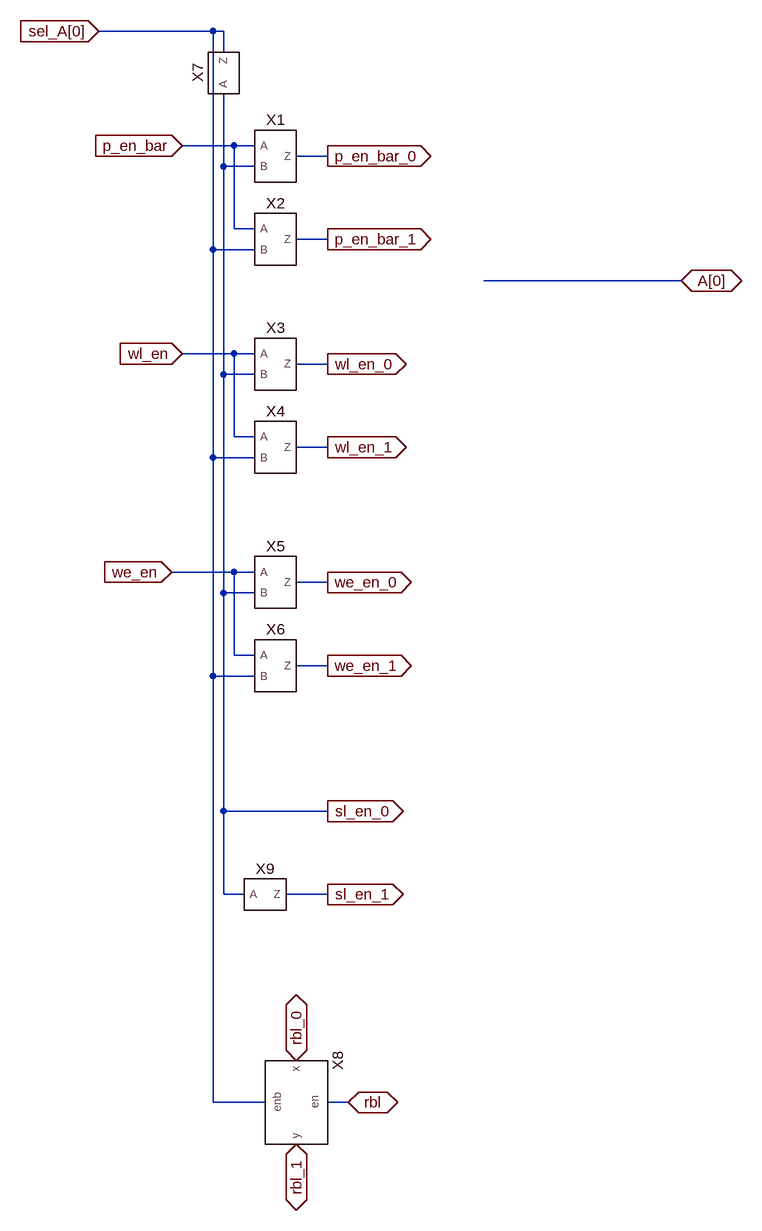
[diagram p0: schematic array_seclector.asc]
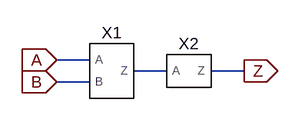
[diagram p1: sub-circuit and2.asc]
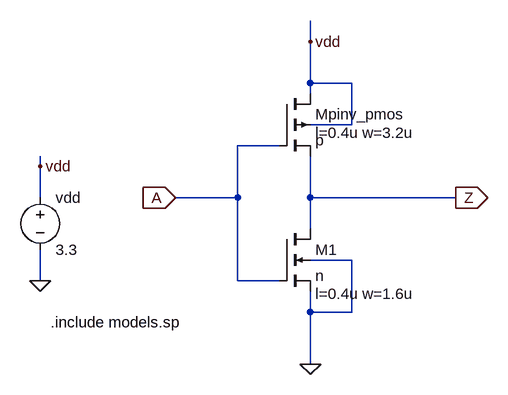
[diagram p2: sub-circuit inv.asc]
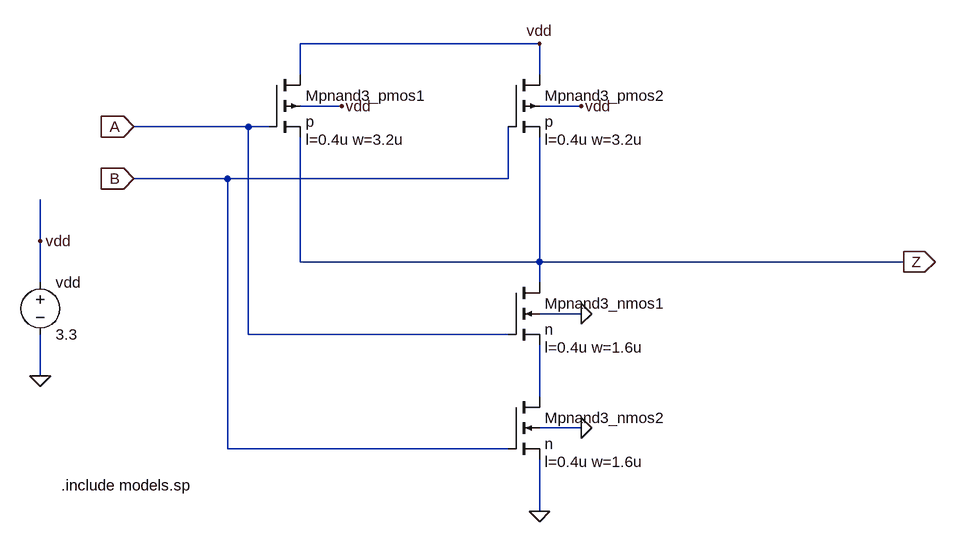
[diagram p3: sub-circuit nand2.asc]
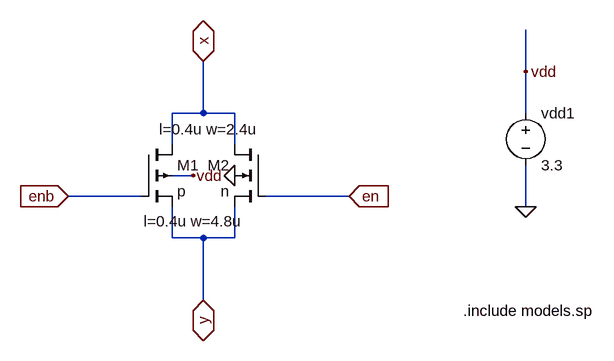
[diagram p4: sub-circuit tri_gate.asc]
array_seclector.asc, the LTspice schematic file:
Version 4
SHEET 1 1136 1560
WIRE 304 -272 128 -272
WIRE 320 -272 304 -272
WIRE 320 -240 320 -272
WIRE 336 -96 256 -96
WIRE 368 -96 336 -96
WIRE 480 -80 432 -80
WIRE 320 -64 320 -176
WIRE 368 -64 320 -64
WIRE 336 32 336 -96
WIRE 368 32 336 32
WIRE 480 48 432 48
WIRE 304 64 304 -272
WIRE 368 64 304 64
WIRE 1024 112 720 112
WIRE 336 224 256 224
WIRE 368 224 336 224
WIRE 480 240 432 240
WIRE 320 256 320 -64
WIRE 368 256 320 256
WIRE 336 352 336 224
WIRE 368 352 336 352
WIRE 480 368 432 368
WIRE 304 384 304 64
WIRE 368 384 304 384
WIRE 336 560 240 560
WIRE 368 560 336 560
WIRE 480 576 432 576
WIRE 320 592 320 256
WIRE 368 592 320 592
WIRE 336 688 336 560
WIRE 368 688 336 688
WIRE 480 704 432 704
WIRE 304 720 304 384
WIRE 368 720 304 720
WIRE 320 928 320 592
WIRE 480 928 320 928
WIRE 320 1056 320 928
WIRE 352 1056 320 1056
WIRE 480 1056 416 1056
WIRE 304 1376 304 720
WIRE 384 1376 304 1376
WIRE 512 1376 480 1376
FLAG 128 -272 sel_A[0]
IOPIN 128 -272 In
FLAG 256 -96 p_en_bar
IOPIN 256 -96 In
FLAG 256 224 wl_en
IOPIN 256 224 In
FLAG 240 560 we_en
IOPIN 240 560 In
FLAG 480 -80 p_en_bar_0
IOPIN 480 -80 Out
FLAG 480 48 p_en_bar_1
IOPIN 480 48 Out
FLAG 480 240 wl_en_0
IOPIN 480 240 Out
FLAG 480 368 wl_en_1
IOPIN 480 368 Out
FLAG 480 576 we_en_0
IOPIN 480 576 Out
FLAG 480 704 we_en_1
IOPIN 480 704 Out
FLAG 432 1312 rbl_0
IOPIN 432 1312 BiDir
FLAG 432 1440 rbl_1
IOPIN 432 1440 BiDir
FLAG 512 1376 rbl
IOPIN 512 1376 BiDir
FLAG 480 928 sl_en_0
IOPIN 480 928 Out
FLAG 480 1056 sl_en_1
IOPIN 480 1056 Out
FLAG 1024 112 A[0]
IOPIN 1024 112 BiDir
SYMBOL and2 400 -80 R0
SYMATTR InstName X1
SYMBOL and2 400 48 R0
SYMATTR InstName X2
SYMBOL and2 400 240 R0
SYMATTR InstName X3
SYMBOL and2 400 368 R0
SYMATTR InstName X4
SYMBOL and2 400 576 R0
SYMATTR InstName X5
SYMBOL and2 400 704 R0
SYMATTR InstName X6
SYMBOL inv 320 -208 R270
SYMATTR InstName X7
SYMBOL tri_gate 432 1376 R90
SYMATTR InstName X8
SYMBOL inv 384 1056 R0
SYMATTR InstName X9

and2.asc, the sub-circuit schematic file:
Version 4
SHEET 1 880 680
WIRE 48 96 0 96
WIRE 160 112 112 112
WIRE 272 112 224 112
WIRE 48 128 0 128
FLAG 0 96 A
IOPIN 0 96 In
FLAG 0 128 B
IOPIN 0 128 In
FLAG 272 112 Z
IOPIN 272 112 Out
SYMBOL inv 192 112 R0
SYMATTR InstName X2
SYMBOL nand2 80 112 R0
SYMATTR InstName X1

inv.asc, the sub-circuit schematic file:
Version 4
SHEET 1 880 680
WIRE 112 -128 112 -160
WIRE 112 -64 112 -128
WIRE 176 -64 112 -64
WIRE 112 -48 112 -64
WIRE 176 0 176 -64
WIRE 176 0 112 0
WIRE 64 32 0 32
WIRE -304 64 -304 48
WIRE -304 112 -304 64
WIRE 0 112 0 32
WIRE 0 112 -96 112
WIRE 112 112 112 48
WIRE 336 112 112 112
WIRE 112 160 112 112
WIRE 176 208 112 208
WIRE -304 240 -304 192
WIRE 0 240 0 112
WIRE 64 240 0 240
WIRE 112 288 112 256
WIRE 176 288 176 208
WIRE 176 288 112 288
WIRE 112 368 112 288
FLAG -96 112 A
IOPIN -96 112 In
FLAG 336 112 Z
IOPIN 336 112 Out
FLAG 112 368 0
FLAG -304 240 0
FLAG 112 -128 vdd
FLAG -304 64 vdd
SYMBOL nmos4 64 160 R0
WINDOW 123 56 100 Left 2
SYMATTR Value2 l=0.4u w=1.6u
SYMATTR InstName M1
SYMATTR Value n
SYMBOL pmos4 64 -48 R0
WINDOW 123 56 60 Left 2
SYMATTR Value2 l=0.4u w=3.2u
SYMATTR InstName Mpinv_pmos
SYMATTR Value p
SYMBOL voltage -304 96 R0
SYMATTR InstName vdd
SYMATTR Value 3.3
TEXT -288 304 Left 2 !.include models.sp

nand2.asc, the sub-circuit schematic file:
Version 4
SHEET 1 1192 1028
WIRE 560 128 192 128
WIRE 192 176 192 128
WIRE 560 176 560 128
WIRE 256 224 192 224
WIRE 624 224 560 224
WIRE 112 256 -64 256
WIRE 144 256 112 256
WIRE 80 336 -64 336
WIRE 512 336 512 256
WIRE 512 336 80 336
WIRE -208 432 -208 368
WIRE 192 464 192 272
WIRE 560 464 560 272
WIRE 560 464 192 464
WIRE 1120 464 560 464
WIRE -208 496 -208 432
WIRE 560 496 560 464
WIRE 624 544 560 544
WIRE 112 576 112 256
WIRE 512 576 112 576
WIRE -208 640 -208 576
WIRE 560 672 560 592
WIRE 624 720 560 720
WIRE 80 752 80 336
WIRE 512 752 80 752
WIRE 560 848 560 768
FLAG -64 256 A
IOPIN -64 256 In
FLAG -64 336 B
IOPIN -64 336 In
FLAG 1120 464 Z
IOPIN 1120 464 Out
FLAG -208 640 0
FLAG 624 544 0
FLAG 624 720 0
FLAG -208 432 vdd
FLAG 256 224 vdd
FLAG 624 224 vdd
FLAG 560 848 0
FLAG 560 128 vdd
SYMBOL pmos4 144 176 R0
WINDOW 123 56 100 Left 2
SYMATTR Value2 l=0.4u w=3.2u
SYMATTR InstName Mpnand3_pmos1
SYMATTR Value p
SYMBOL pmos4 512 176 R0
WINDOW 123 56 100 Left 2
SYMATTR Value2 l=0.4u w=3.2u
SYMATTR InstName Mpnand3_pmos2
SYMATTR Value p
SYMBOL nmos4 512 496 R0
WINDOW 123 56 100 Left 2
SYMATTR Value2 l=0.4u w=1.6u
SYMATTR InstName Mpnand3_nmos1
SYMATTR Value n
SYMBOL nmos4 512 672 R0
WINDOW 123 56 100 Left 2
SYMATTR Value2 l=0.4u w=1.6u
SYMATTR InstName Mpnand3_nmos2
SYMATTR Value n
SYMBOL voltage -208 480 R0
WINDOW 123 0 0 Left 0
WINDOW 39 0 0 Left 0
SYMATTR InstName vdd
SYMATTR Value 3.3
TEXT -176 808 Left 2 !.include models.sp

tri_gate.asc, the sub-circuit schematic file:
Version 4
SHEET 1 880 680
WIRE 576 -16 576 -80
WIRE 80 48 80 -32
WIRE 80 48 32 48
WIRE 128 48 80 48
WIRE 576 48 576 -16
WIRE 32 96 32 48
WIRE 128 96 128 48
WIRE 64 144 32 144
WIRE -16 176 -128 176
WIRE 304 176 176 176
WIRE 576 192 576 128
WIRE 32 240 32 192
WIRE 80 240 32 240
WIRE 128 240 128 192
WIRE 128 240 80 240
WIRE 80 336 80 240
FLAG 128 144 0
FLAG 64 144 vdd
FLAG 576 192 0
FLAG 576 -16 vdd
FLAG 80 336 y
IOPIN 80 336 BiDir
FLAG 80 -32 x
IOPIN 80 -32 BiDir
FLAG 304 176 en
IOPIN 304 176 In
FLAG -128 176 enb
IOPIN -128 176 In
SYMBOL pmos4 -16 96 R0
WINDOW 123 4 118 Left 2
SYMATTR Value2 l=0.4u w=4.8u
SYMATTR InstName M1
SYMATTR Value p
SYMBOL nmos4 176 96 M0
WINDOW 123 12 -23 Left 2
SYMATTR Value2 l=0.4u w=2.4u
SYMATTR InstName M2
SYMATTR Value n
SYMBOL voltage 576 32 R0
WINDOW 123 0 0 Left 0
WINDOW 39 0 0 Left 0
SYMATTR InstName vdd1
SYMATTR Value 3.3
TEXT 480 352 Left 2 !.include models.sp

The netlist it stands for:
* array_seclector.asc
XX1 p_en_bar sl_en_0 p_en_bar_0 and2
XX2 p_en_bar sel_A[0] p_en_bar_1 and2
XX3 wl_en sl_en_0 wl_en_0 and2
XX4 wl_en sel_A[0] wl_en_1 and2
XX5 we_en sl_en_0 we_en_0 and2
XX6 we_en sel_A[0] we_en_1 and2
XX7 sl_en_0 sel_A[0] inv
XX8 rbl sel_A[0] rbl_0 rbl_1 tri_gate
XX9 sl_en_0 sl_en_1 inv

* block symbol definitions
.subckt and2 A B Z
XX2 N001 Z inv
XX1 A B N001 nand2
.ends and2

.subckt inv A Z
M1 Z A 0 0 n l=0.4u w=1.6u
Mpinv_pmos vdd A Z vdd p l=0.4u w=3.2u
vdd vdd 0 3.3
.include models.sp
.ends inv

.subckt nand2 A B Z
Mpnand3_pmos1 vdd A Z vdd p l=0.4u w=3.2u
Mpnand3_pmos2 vdd B Z vdd p l=0.4u w=3.2u
Mpnand3_nmos1 Z A N001 0 n l=0.4u w=1.6u
Mpnand3_nmos2 N001 B 0 0 n l=0.4u w=1.6u
vdd vdd 0 3.3
.include models.sp
.ends nand2

.subckt tri_gate en enb x y
M1 x enb y vdd p l=0.4u w=4.8u
M2 x en y 0 n l=0.4u w=2.4u
vdd1 vdd 0 3.3
.include models.sp
.ends tri_gate

.model NMOS NMOS
.model PMOS PMOS
.lib standard.mos
.backanno
.end